# Altium project DA-12_MB.PrjPcb (part 2 of 4)
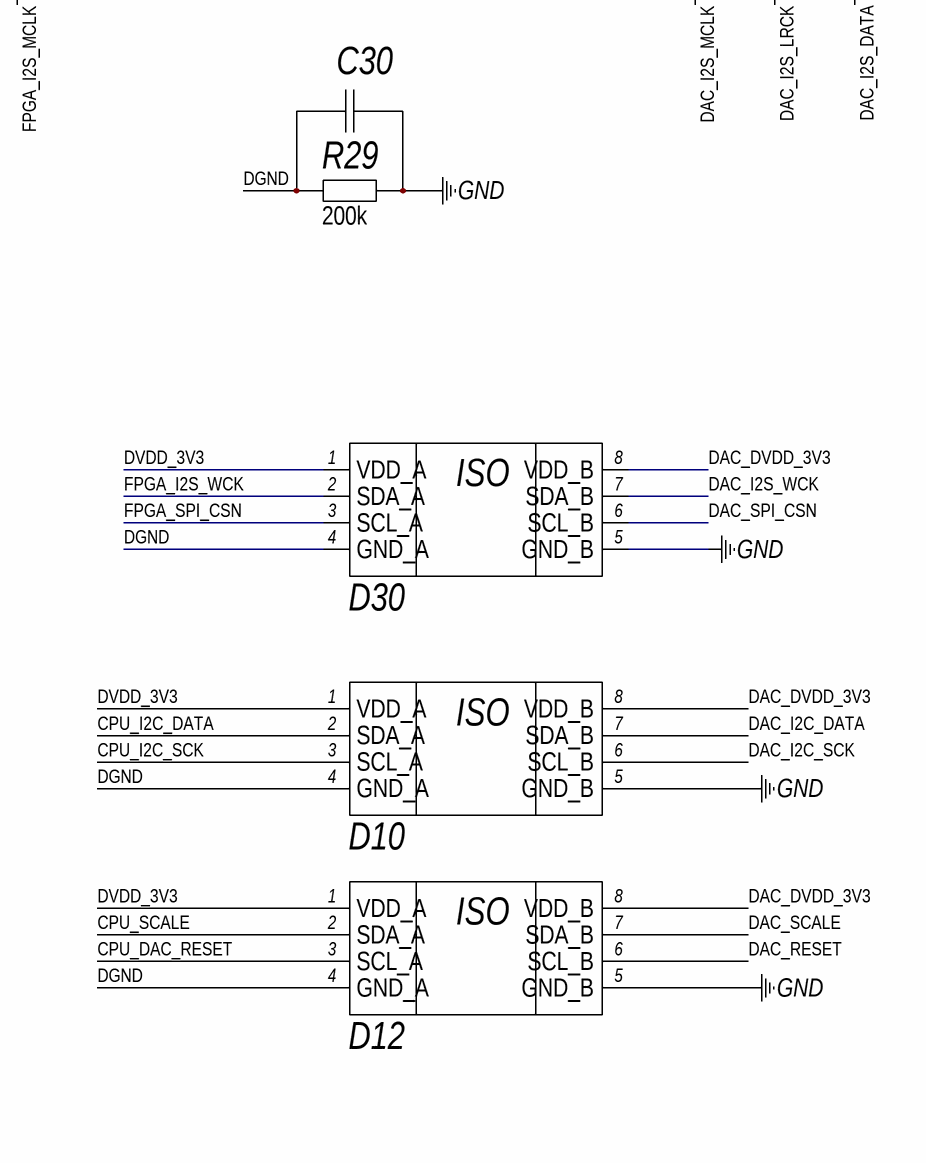
[diagram p14: da12-mb.SchDoc, bottom right]

## Sheet da12-mb.SchDoc (continued)

### Library data of the parts
C1 C3 C7 C8 C11 C15-C29 C32 C35 C37 C39 C42 C44 C191 C193 C195 C198 C199 C202-C235 = CC0805MRX7R9BB104: Ceramic capacitor 0805 X7R 0.1µF 50V; Manufacturer 1: Yageo; Tolerance: 20%; Capacitance: 100nF; Value: 0.1u; Type: Конденсатор; Supplier 1: Digi-Key; Supplier Part Number 1: 311-4351-1-ND; Manufacturer Part Number 1: CC0805MRX7R9BB104; RoHS: Yes; Category: Ceramic Capacitors; Stock 1: 29978; Pricing 1: 1=0,15000, 10=0,10700, 50=0,06080, 100=0,05040, 500=0,03536, 1000=0,02927 (USD); Mount: SMT; Case/Package: 0805; Min Operating Temperature: -55°C; Max Operating Temperature: 125°C; Packaging: Tape and Reel; Dielectric: X7R; Voltage Rating: 50V; Voltage Rating (DC): 50V; Series: CC; Length: 0.079inch; Width: 0.049inch; Thickness: 0.037inch; Depth: 1.25mm; Lead Free: Lead Free; Halogen Free: Halogen Free; RoHS Compliant: Yes; ComponentLink1URL: https://datasheet.ciiva.com/13207/upy-gphc-x7r-6-3v-to-50v-8-12304-13207535.pdf?src-supplier=Mouser; ComponentLink1Description: https://datasheet.ciiva.com/13207/upy-gphc-x7r-6-3v-to-50v-8-12304-13207535.pdf?src-supplier=Mouser; Case Code (Imperial): 0805; Case Code (Metric): 2012; Voltage: 50V
C4 = EEEFK1A102AP: Aluminium capacitor 10x10.2 1000 µF 10 V; Capacitance: 1mF; Tolerance: 20%; Ripple Current: 850mA; Voltage Rating: 10V; Impedance: 80mR; Life (Hours): 2000Hour; Leakage Current: 100uA; Dissipation Factor: 0.19%; Lead Length: 3.5mm; Value: 1mX10V; Type: Конденсатор электролитический; Supplier 1: Avnet; Supplier Part Number 1: EEE-FK1E471GP; Supplier 2: Arrow Electronics; Manufacturer 2: Panasonic; Manufacturer Part Number 2: EEE-FK1A102AP; RoHS: Yes; Category: Aluminum Electrolytic Capacitors; Stock 2: 4; Pricing 2: 1=0,75620, 500=0,34460 (USD); Mount: SMT; Case/Package: 10x10,2 (SMD-2); Number of Pins: 2; Contact Plating: Tin; Dielectric Material: Aluminium; Min Operating Temperature: -55°C; Max Operating Temperature: 105°C; Packaging: Tape and Reel; Voltage Rating (DC): 10V; Package Quantity: 500; Ripple Current (AC): 850mA; ESR (Equivalent Series Resistance): 80mR; Termination: SMD/SMT; Voltage: 10V; Series: FK; Construction: Cylindrical; Diameter: 10mm; Length: 10.2mm; Width: 10.3mm; Height: 10.2mm; Height - Seated (Max): 0.402inch; Lead Pitch: 4.6mm; Radiation Hardening: No; Lead Free: Lead Free; REACH SVHC: Unknown; RoHS Compliant: Yes; ComponentLink1URL: https://datasheet.ciiva.com/11783/0900766b80bed286-11783449.pdf?src-supplier=RSComponents; ComponentLink1Description: https://datasheet.ciiva.com/11783/0900766b80bed286-11783449.pdf?src-supplier=RSComponents; ComponentLink2URL: https://datasheet.ciiva.com/43454/58258-43454698.pdf?src-supplier=Farnell; ComponentLink2Description: https://datasheet.ciiva.com/43454/58258-43454698.pdf?src-supplier=Farnell; ComponentLink3URL: https://datasheet.ciiva.com/46388/58258-46388200.pdf?src-supplier=Element14; ComponentLink3Description: https://datasheet.ciiva.com/46388/58258-46388200.pdf?src-supplier=Element14; ComponentLink4URL: https://datasheet.ciiva.com/24024/aba0000ce120-24024165.pdf?src-supplier=Mouser; ComponentLink4Description: https://datasheet.ciiva.com/24024/aba0000ce120-24024165.pdf?src-supplier=Mouser; ComponentLink5URL: https://datasheet.ciiva.com/14602/70068081-14602683.pdf?src-supplier=Allied+Electronics; ComponentLink5Description: https://datasheet.ciiva.com/14602/70068081-14602683.pdf?src-supplier=Allied+Electronics; ComponentLink6URL: https://datasheet.ciiva.com/14607/70068081-14607445.pdf?src-supplier=Allied+Electronics; ComponentLink6Description: https://datasheet.ciiva.com/14607/70068081-14607445.pdf?src-supplier=Allied+Electronics; ComponentLink7URL: https://datasheet.ciiva.com/2985/aba0000ce119-2985368.pdf?src-supplier=Avnet; ComponentLink7Description: https://datasheet.ciiva.com/2985/aba0000ce119-2985368.pdf?src-supplier=Avnet; ComponentLink8URL: https://datasheet.ciiva.com/2985/aba0000ce119-2985367.pdf?src-supplier=Avnet; ComponentLink8Description: https://datasheet.ciiva.com/2985/aba0000ce119-2985367.pdf?src-supplier=Avnet; Case Code (Metric): 10x10.2
C5 C9 C31 C34 C36 C38 C41 C43 C189 C190 C194 C196 = TANT_B: Описание свойств компонента
C6 C10 C14 C197 = CC0805JRNPO9BN160: Ceramic capacitor 0805 C0G 16pF 50V; Manufacturer 1: Yageo; Manufacturer Part Number 1: CC0805JRNPO9BN220; Tolerance: 5%; Capacitance: 22pF; Value: 16p; Type: Конденсатор; Supplier 1: Digi-Key; Supplier Part Number 1: 311-1103-1-ND; RoHS: Yes; Category: Ceramic Capacitors; Stock 1: 117464; Pricing 1: 1=0,11000, 10=0,07800, 50=0,04280, 100=0,03490, 500=0,02492, 1000=0,01958 (USD); Mount: SMT; Case/Package: 0805; Number of Pins: 2; Case Code (Imperial): 0805; Case Code (Metric): 2012; Dielectric Material: Ceramic; Min Operating Temperature: -55°C; Max Operating Temperature: 125°C; Dielectric: C0G; Voltage Rating: 50V; Voltage Rating (DC): 50V; Packaging: Tape and Reel; Package Quantity: 1; Termination: SMD/SMT; Resistor Type: Ceramic; Voltage: 50V; Series: CC; Construction: Flat; Length: 2mm; Width: 1.25mm; Height: 0.6mm; Depth: 1.25mm; Thickness: 0.024inch; Radiation Hardening: No; REACH SVHC: No SVHC; Lead Free: Lead Free; RoHS Compliant: Yes; ComponentLink1URL: https://datasheet.ciiva.com/144/mlccorderingcode-144745.pdf?src-supplier=Digi-Key; ComponentLink1Description: https://datasheet.ciiva.com/144/mlccorderingcode-144745.pdf?src-supplier=Digi-Key; ComponentLink2URL: https://datasheet.ciiva.com/8033/1734582-8033931.pdf?src-supplier=Element14; ComponentLink2Description: https://datasheet.ciiva.com/8033/1734582-8033931.pdf?src-supplier=Element14; ComponentLink3URL: https://datasheet.ciiva.com/8033/1734582-8033933.pdf?src-supplier=Element14; ComponentLink3Description: https://datasheet.ciiva.com/8033/1734582-8033933.pdf?src-supplier=Element14; ComponentLink4URL: https://datasheet.ciiva.com/144/mlccorderingcode-144746.pdf?src-supplier=Digi-Key; ComponentLink4Description: https://datasheet.ciiva.com/144/mlccorderingcode-144746.pdf?src-supplier=Digi-Key; ComponentLink5URL: https://datasheet.ciiva.com/144/mlccorderingcode-144747.pdf?src-supplier=Digi-Key; ComponentLink5Description: https://datasheet.ciiva.com/144/mlccorderingcode-144747.pdf?src-supplier=Digi-Key; Supplier 2: Digi-Key; Manufacturer 2: Yageo; Manufacturer Part Number 2: CC0805JRNPO9BN160; Stock 2: 956; Pricing 2: 1=0,15000, 10=0,10700, 50=0,06080, 100=0,05040, 500=0,03536, 1000=0,02927 (USD); Weight: 0.000194oz; ComponentLink6URL: https://datasheet.ciiva.com/13264/upy-gp-np0-16v-to-50v-8-3714-13264491.pdf?src-supplier=Mouser; ComponentLink6Description: https://datasheet.ciiva.com/13264/upy-gp-np0-16v-to-50v-8-3714-13264491.pdf?src-supplier=Mouser; Supplier Part Number 2: 311-4228-1-ND
C12 C13 C200 C201 = CC0805JRNPO7BN220: Ceramic capacitor 0805 NPO 22pF 16V; Manufacturer 1: Yageo; Manufacturer Part Number 1: CC0805JRNPO9BN220; Tolerance: 5%; Dielectric: C0G; Voltage Rating: 50V; Value: 22p; Type: Конденсатор; Supplier 1: Digi-Key; Supplier Part Number 1: 311-1103-1-ND; RoHS: Yes; Category: Ceramic Capacitors; Stock 1: 117464; Pricing 1: 1=0,11000, 10=0,07800, 50=0,04280, 100=0,03490, 500=0,02492, 1000=0,01958 (USD); Mount: SMT; Case/Package: 0805; Number of Pins: 2; Case Code (Imperial): 0805; Case Code (Metric): 2012; Dielectric Material: Ceramic; Min Operating Temperature: -55°C; Max Operating Temperature: 125°C; Capacitance: 22pF; Voltage Rating (DC): 50V; Packaging: Tape and Reel; Package Quantity: 1; Termination: SMD/SMT; Resistor Type: Ceramic; Voltage: 50V; Series: CC; Construction: Flat; Length: 2mm; Width: 1.25mm; Height: 0.6mm; Depth: 1.25mm; Thickness: 0.024inch; Radiation Hardening: No; REACH SVHC: No SVHC; Lead Free: Lead Free; RoHS Compliant: Yes; ComponentLink1URL: https://datasheet.ciiva.com/144/mlccorderingcode-144745.pdf?src-supplier=Digi-Key; ComponentLink1Description: https://datasheet.ciiva.com/144/mlccorderingcode-144745.pdf?src-supplier=Digi-Key; ComponentLink2URL: https://datasheet.ciiva.com/8033/1734582-8033931.pdf?src-supplier=Element14; ComponentLink2Description: https://datasheet.ciiva.com/8033/1734582-8033931.pdf?src-supplier=Element14; ComponentLink3URL: https://datasheet.ciiva.com/8033/1734582-8033933.pdf?src-supplier=Element14; ComponentLink3Description: https://datasheet.ciiva.com/8033/1734582-8033933.pdf?src-supplier=Element14; ComponentLink4URL: https://datasheet.ciiva.com/144/mlccorderingcode-144746.pdf?src-supplier=Digi-Key; ComponentLink4Description: https://datasheet.ciiva.com/144/mlccorderingcode-144746.pdf?src-supplier=Digi-Key; ComponentLink5URL: https://datasheet.ciiva.com/144/mlccorderingcode-144747.pdf?src-supplier=Digi-Key; ComponentLink5Description: https://datasheet.ciiva.com/144/mlccorderingcode-144747.pdf?src-supplier=Digi-Key
C30 = GRM31CR71A226KE15L: Ceramic capacitor 1206 X7R 22µF 10V; Manufacturer 1: Murata; Capacitance: 22uF; Tolerance: 10%; Value: 22u; Type: Конденсатор; Supplier 1: Arrow Electronics; Supplier Part Number 1: GRM31CR71A226KE15L; Manufacturer Part Number 1: GRM31CR71A226KE15L; RoHS: Yes; Category: Ceramic Capacitors; Stock 1: 16303; Pricing 1: 1=0,81930, 10=0,51230, 25=0,48340, 100=0,42480, 250=0,42420, 500=0,35180, 1000=0,34810, 3000=0,30810, 6000=0,24770, 15000=0,23430 (USD); Mount: SMT; Case/Package: 1206; Case Code (Metric): 3216; Case Code (Imperial): 1206; Material: Ceramic; Min Operating Temperature: -55°C; Max Operating Temperature: 125°C; Dielectric: X7R; Packaging: Tape and Reel; Package Quantity: 1; Voltage Rating: 10V; Voltage Rating (DC): 10V; Termination: SMD/SMT; Voltage: 10V; Series: GRM; Construction: Flat; Length: 3.2mm; Width: 0.063inch; Height: 1.6mm; Thickness: 0.071inch; Depth: 1.6mm; Radiation Hardening: No; REACH SVHC: No SVHC; Lead Free: Lead Free; RoHS Compliant: Yes; ComponentLink1URL: https://datasheet.ciiva.com/6072/1747483-6072695.pdf?src-supplier=Farnell; ComponentLink1Description: https://datasheet.ciiva.com/6072/1747483-6072695.pdf?src-supplier=Farnell; ComponentLink2URL: https://datasheet.ciiva.com/11787/0900766b80ef921d-11787760.pdf?src-supplier=RSComponents; ComponentLink2Description: https://datasheet.ciiva.com/11787/0900766b80ef921d-11787760.pdf?src-supplier=RSComponents; ComponentLink3URL: https://datasheet.ciiva.com/3777/1492grm31cr71a226ke1523-3777120.pdf?src-supplier=Arrow+Electronics; ComponentLink3Description: https://datasheet.ciiva.com/3777/1492grm31cr71a226ke1523-3777120.pdf?src-supplier=Arrow+Electronics; ComponentLink4URL: https://datasheet.ciiva.com/29202/451120-da-01-de-vs-chip-kond-1206-22-0-uf-10pr-10-0v-x7r-29202604.pdf?src-supplier=Conrad; ComponentLink4Description: https://datasheet.ciiva.com/29202/451120-da-01-de-vs-chip-kond-1206-22-0-uf-10pr-10-0v-x7r-29202604.pdf?src-supplier=Conrad; ComponentLink5URL: https://datasheet.ciiva.com/29202/451412-da-01-de-vs-kondens-grm31-cr71a-226ke15l-29202268.pdf?src-supplier=Conrad; ComponentLink5Description: https://datasheet.ciiva.com/29202/451412-da-01-de-vs-kondens-grm31-cr71a-226ke15l-29202268.pdf?src-supplier=Conrad; ComponentLink6URL: https://datasheet.ciiva.com/14116/grmseries-highdielectrictype-eng-14116398.pdf?src-supplier=Distrelec; ComponentLink6Description: https://datasheet.ciiva.com/14116/grmseries-highdielectrictype-eng-14116398.pdf?src-supplier=Distrelec; ComponentLink7URL: https://datasheet.ciiva.com/7937/1747483-7937735.pdf?src-supplier=Element14; ComponentLink7Description: https://datasheet.ciiva.com/7937/1747483-7937735.pdf?src-supplier=Element14; ComponentLink8URL: https://datasheet.ciiva.com/142/partnumbering-e-01-142120.pdf?src-supplier=Digi-Key; ComponentLink8Description: https://datasheet.ciiva.com/142/partnumbering-e-01-142120.pdf?src-supplier=Digi-Key; ComponentLink9URL: https://datasheet.ciiva.com/142/partnumbering-e-01-142119.pdf?src-supplier=Digi-Key; ComponentLink9Description: https://datasheet.ciiva.com/142/partnumbering-e-01-142119.pdf?src-supplier=Digi-Key; ComponentLink10URL: https://datasheet.ciiva.com/142/partnumbering-e-01-142121.pdf?src-supplier=Digi-Key; ComponentLink10Description: https://datasheet.ciiva.com/142/partnumbering-e-01-142121.pdf?src-supplier=Digi-Key; ComponentLink11URL: https://datasheet.ciiva.com/48671/product-48671339.pdf?src-supplier=Avnet; ComponentLink11Description: https://datasheet.ciiva.com/48671/product-48671339.pdf?src-supplier=Avnet; ComponentLink12URL: https://datasheet.ciiva.com/16440/product-16440671.pdf?src-supplier=Future+Electronics; ComponentLink12Description: https://datasheet.ciiva.com/16440/product-16440671.pdf?src-supplier=Future+Electronics; ComponentLink13URL: https://datasheet.ciiva.com/2989/product-2989773.pdf?src-supplier=Avnet; ComponentLink13Description: https://datasheet.ciiva.com/2989/product-2989773.pdf?src-supplier=Avnet
C33 C40 C192 = CC0805MRX7R9BB101: Ceramic capacitor 0805 X7R 100pF 50V; Capacitance: 1nF; Tolerance: 20%; Value: 100p; Type: Конденсатор; Supplier 1: Digi-Key; Supplier Part Number 1: 311-4349-1-ND; Supplier 2: Mouser; Manufacturer 2: Yageo; Manufacturer Part Number 2: CC0805MRX7R9BB102; RoHS: Yes; Category: Ceramic Capacitors; Stock 2: 5617; Pricing 2: 1=0,14000, 10=0,08800, 50=0,08800, 100=0,03900, 1000=0,02500, 10000=0,02100 (USD); Mount: SMT; Case/Package: 0805; Min Operating Temperature: -55°C; Max Operating Temperature: 125°C; Packaging: Tape and Reel; Voltage Rating (DC): 50V; Dielectric: X7R; Resistor Type: Ceramic; Voltage Rating: 50V; Series: CC; Length: 0.079inch; Width: 0.049inch; Thickness: 0.028inch; Depth: 1.25mm; Lead Free: Lead Free; Halogen Free: Halogen Free; RoHS Compliant: Yes; ComponentLink1URL: http://www.mouser.com/ds/2/447/Yageo_UPY-GP_NP0_16V-to-50V_9-358835.pdf?src-supplier=Mouser; ComponentLink1Description: http://www.mouser.com/ds/2/447/Yageo_UPY-GP_NP0_16V-to-50V_9-358835.pdf?src-supplier=Mouser; ComponentLink2URL: http://components.arrow.com/part/dataview/0323_04166629?src-supplier=Arrow+Europe; ComponentLink2Description: http://components.arrow.com/part/dataview/0323_04166629?src-supplier=Arrow+Europe; ComponentLink3URL: http://www.yageo.com/documents/recent/UPY-GPHC_X7R_6.3V-to-50V_18.pdf?src-supplier=Digi-Key; ComponentLink3Description: http://www.yageo.com/documents/recent/UPY-GPHC_X7R_6.3V-to-50V_18.pdf?src-supplier=Digi-Key; Supplier Part Number 2: 603-CC805MRX7R9BB102; Case Code (Imperial): 0805; Case Code (Metric): 2012; Voltage: 50V
D1 = USBLC6-4SC6: Very low capacitance ESD protection; Type: Микросхема; Case/Package: SOT-23-6; Mount: SMT; Supplier 1: Future Electronics; Supplier Part Number 1: 7131158; Value: USBLC6-4SC6
D2 = SN74LVC1G14DBVR: Single Schmitt-Trigger Inverter; Type: Микросхема; Supplier 1: Digi-Key; Supplier Part Number 1: 296-11607-1-ND; Case/Package: SOT-23-5; Mount: SMT; Value: SN74LVC1G14
D3 D5 D32 = OSC_4PIN_DIL: Описание свойств компонента
D4 = CT7601: Описание свойств компонента
D6 = 1G32: Описание свойств компонента
D7 D33 = W25Q32JVSS: 3V 32M-BIT SERIAL FLASH MEMORY WITH DUAL, QUAD SPI; Type: Микросхема; Value: W25Q32; Supplier 1: Digi-Key; Supplier Part Number 1: W25Q32JVSSIQCT-ND; Case/Package: SOIC-8-208; Mount: SMT; Supplier 2: Digi-Key; Supplier 3: RSComponents; Supplier 4: Arrow Electronics; Supplier 5: RSComponents; Supplier Part Number 2: W25Q32JVSSIQ-ND; Supplier Part Number 3: 1882528; Supplier Part Number 4: W25Q32JVSSIM TR; Supplier Part Number 5: 1712228
D8 = ADUM140X: Описание свойств компонента
D9 D11 D31 = SY8088: Описание свойств компонента
D10 D12 D30 = ADUM1250: Описание свойств компонента
J = USB-B-S-X-X-TH-TR: USB-B Series USB 2.0 Interface, Type B; MP: USB-B-S-S-B-TH-TR; MF: Samtec; Price: None; Availability: Unavailable; Package: None; SnapEDA_Link: https://www.snapeda.com/parts/USB-B-S-S-B-TH-TR/Samtec/view-part/230657/?ref=snap; Value: *
L1-L6 L9 L12 L24 L25 = SMD_BLM0805: Описание свойств компонента
L7 L8 L10 L11 L22 L23 = LQH32MN220J23L: Chip Coils for DC-DC Converter Wire Wound Type / LQH32MN_23 Series 1210 (3225) 220 uH, 150 mA; Type: Катушка индуктивности; Value: 1210; Supplier 1: Digi-Key; Supplier Part Number 1: 490-4048-1-ND; Case/Package: SMD-2; Mount: SMT
P1 P2 = Header 5X2: Header, 5-Pin, Dual row; LatestRevisionDate: 17-Jul-2002; LatestRevisionNote: Re-released for DXP Platform.; Publisher: Altium Limited
P3 = Header 3: Header, 3-Pin; LatestRevisionDate: 17-Jul-2002; LatestRevisionNote: Re-released for DXP Platform.; Publisher: Altium Limited
R2-R5 R28 R30-R32 = RC0805JR-0710KL: Chip Resistor Surface Mount 0805 10 кОм; Manufacturer 1: Yageo; Tolerance: 5%; Resistance: 10kR; Power Rating: 125mW; Temperature Coefficient: 100ppm/°C; Voltage Rating: 150V; Value: 10k; Supplier 1: RSComponents; Supplier Part Number 1: 1995759; Manufacturer Part Number 1: RC0805JR-0710KL; RoHS: Yes; Category: Chip SMD Resistors; Stock 1: 30000; Pricing 1: 5000=0,00300 (GBP); Case/Package: 0805; Contact Plating: Tin,Matte; Case Code (Imperial): 0805; Case Code (Metric): 2012; Size Code: 0805; Min Operating Temperature: -55°C; Max Operating Temperature: 155°C; Resistor Type: Thick Film; Packaging: Tape and Reel; Termination: SMD/SMT; Features: Moisture Resistant; Series: RC; Max Power Dissipation: 125mW; Number of Terminations: 2; Resistance Tolerance: 5%; Construction: Rectangular; Length: 2mm; Width: 1.25mm; Height: 0.5mm; Depth: 1.25mm; Radiation Hardening: No; RoHS Compliant: Yes; REACH SVHC: Unknown; Military Standard: Not; Lead Free: Lead Free; ComponentLink1URL: https://datasheet.ciiva.com/7983/444164-7983765.pdf?src-supplier=Element14; ComponentLink1Description: https://datasheet.ciiva.com/7983/444164-7983765.pdf?src-supplier=Element14; ComponentLink2URL: https://datasheet.ciiva.com/7941/444164-7941870.pdf?src-supplier=Element14; ComponentLink2Description: https://datasheet.ciiva.com/7941/444164-7941870.pdf?src-supplier=Element14; ComponentLink3URL: https://datasheet.ciiva.com/7941/444164-7941871.pdf?src-supplier=Element14; ComponentLink3Description: https://datasheet.ciiva.com/7941/444164-7941871.pdf?src-supplier=Element14; Mount: SMT; Type: Резистор
R7 R8 = RC0805JR-0724RL: Chip Resistor Surface Mount 0805 24 Ом; Manufacturer 1: Yageo; Resistance: 24R; Tolerance: 5%; Temperature Coefficient: 100ppm/°C; Power Rating: 125mW; Voltage Rating: 150V; Value: 24; Supplier 1: Arrow Electronics; Supplier Part Number 1: RC0805JR-0724RL; Manufacturer Part Number 1: RC0805JR-0724RL; RoHS: Yes; Category: Chip SMD Resistors; Stock 1: 375; Pricing 1: 1=0,06100, 10=0,03050, 25=0,03020, 100=0,01240, 250=0,01230 (USD); Case/Package: 0805; Contact Plating: Tin,Matte,Lead; Case Code (Metric): 2012; Case Code (Imperial): 0805; Size Code: 0805; Min Operating Temperature: -55°C; Max Operating Temperature: 155°C; Resistor Type: Thick Film; Package Quantity: 1; Packaging: Tape and Reel; Number of Terminations: 2; Termination: SMD/SMT; Max Power Dissipation: 125mW; Voltage Rating (DC): 150V; Features: Moisture Resistant; Series: RC; Construction: Rectangular; Length: 2mm; Width: 0.049inch; Height: 0.024inch; Depth: 1.25mm; Radiation Hardening: No; Military Standard: Not; Lead Free: Lead Free; RoHS Compliant: Yes; ComponentLink1URL: https://datasheet.ciiva.com/2456/pyu-r-int-thick-7-2456171.pdf?src-supplier=Digi-Key; ComponentLink1Description: https://datasheet.ciiva.com/2456/pyu-r-int-thick-7-2456171.pdf?src-supplier=Digi-Key; ComponentLink2URL: https://datasheet.ciiva.com/2456/pyu-r-int-thick-7-2456172.pdf?src-supplier=Digi-Key; ComponentLink2Description: https://datasheet.ciiva.com/2456/pyu-r-int-thick-7-2456172.pdf?src-supplier=Digi-Key; ComponentLink3URL: https://datasheet.ciiva.com/2456/pyu-r-int-thick-7-2456170.pdf?src-supplier=Digi-Key; ComponentLink3Description: https://datasheet.ciiva.com/2456/pyu-r-int-thick-7-2456170.pdf?src-supplier=Digi-Key; ComponentLink4URL: https://datasheet.ciiva.com/16776/rc0805-16776854.pdf?src-supplier=Future+Electronics; ComponentLink4Description: https://datasheet.ciiva.com/16776/rc0805-16776854.pdf?src-supplier=Future+Electronics; Mount: SMT; Type: Резистор
R9 R12-R17 R22-R27 R86-R88 R90 R100 R125-R130 R137-R140 R147 = RC0805JR-0710RL: Chip Resistor Surface Mount 0805 10 Ом; Manufacturer 1: Yageo; Tolerance: 5%; Resistance: 10R; Temperature Coefficient: 200ppm/°C; Voltage Rating: 150V; Power Rating: 125mW; Value: 10; Supplier 1: Arrow Electronics; Supplier Part Number 1: RC0805JR-0710RL; Manufacturer Part Number 1: RC0805JR-0710RL; RoHS: Yes; Category: Chip SMD Resistors; Stock 1: 27; Pricing 1: 1=0,07580, 10=0,05800, 25=0,05130 (USD); Case/Package: 0805; Contact Plating: Tin,Matte,Lead; Case Code (Imperial): 0805; Case Code (Metric): 2012; Size Code: 0805; Min Operating Temperature: -55°C; Max Operating Temperature: 155°C; Packaging: Tape and Reel; Resistor Type: Thick Film; Package Quantity: 1; Termination: SMD/SMT; Number of Terminations: 2; Max Power Dissipation: 125mW; Features: Moisture Resistant; Series: RC; Resistance Tolerance: 5%; Length: 0.079inch; Width: 0.049inch; Height: 0.024inch; Radiation Hardening: No; REACH SVHC: Unknown; Lead Free: Lead Free; RoHS Compliant: Yes; ComponentLink1URL: https://datasheet.ciiva.com/46395/444164-46395129.pdf?src-supplier=Element14; ComponentLink1Description: https://datasheet.ciiva.com/46395/444164-46395129.pdf?src-supplier=Element14; ComponentLink2URL: https://datasheet.ciiva.com/2456/pyu-r-int-thick-7-2456041.pdf?src-supplier=Digi-Key; ComponentLink2Description: https://datasheet.ciiva.com/2456/pyu-r-int-thick-7-2456041.pdf?src-supplier=Digi-Key; ComponentLink3URL: https://datasheet.ciiva.com/2456/pyu-r-int-thick-7-2456042.pdf?src-supplier=Digi-Key; ComponentLink3Description: https://datasheet.ciiva.com/2456/pyu-r-int-thick-7-2456042.pdf?src-supplier=Digi-Key; ComponentLink4URL: https://datasheet.ciiva.com/2456/pyu-r-int-thick-7-2456040.pdf?src-supplier=Digi-Key; ComponentLink4Description: https://datasheet.ciiva.com/2456/pyu-r-int-thick-7-2456040.pdf?src-supplier=Digi-Key; ComponentLink5URL: https://datasheet.ciiva.com/12667/rc0805-12667031.pdf?src-supplier=Mouser; ComponentLink5Description: https://datasheet.ciiva.com/12667/rc0805-12667031.pdf?src-supplier=Mouser; Mount: SMT; Type: Резистор
R10 = RC0805JR-0718RL: Chip Resistor Surface Mount 0805 18 Ом; Manufacturer 1: Yageo; Tolerance: 5%; Resistance: 18R; Temperature Coefficient: 100ppm/°C; Power Rating: 125mW; Voltage Rating: 150V; Value: 18; Supplier 1: Arrow Electronics; Supplier Part Number 1: RC0805JR-0718RL; Manufacturer Part Number 1: RC0805JR-0718RL; RoHS: Yes; Category: Chip SMD Resistors; Stock 1: 12330; Pricing 1: 1=0,03540, 10=0,01050, 25=0,01040, 100=0,00430, 250=0,00420, 1000=0,00230, 3000=0,00210, 6000=0,00180 (USD); Case/Package: 0805; Contact Plating: Tin,Matte,Lead; Case Code (Metric): 2012; Case Code (Imperial): 0805; Size Code: 0805; Min Operating Temperature: -55°C; Max Operating Temperature: 155°C; Resistor Type: Thick Film; Package Quantity: 1; Packaging: Tape and Reel; Number of Terminations: 2; Termination: SMD/SMT; Max Power Dissipation: 125mW; Features: Moisture Resistant; Series: RC; Construction: Rectangular; Resistance Tolerance: 5%; Length: 2mm; Width: 0.049inch; Height: 0.024inch; Depth: 1.25mm; Radiation Hardening: No; REACH SVHC: Unknown; Military Standard: Not; Lead Free: Lead Free; RoHS Compliant: Yes; ComponentLink1URL: https://datasheet.ciiva.com/2508/pyu-r-int-thick-7-2508730.pdf?src-supplier=Digi-Key; ComponentLink1Description: https://datasheet.ciiva.com/2508/pyu-r-int-thick-7-2508730.pdf?src-supplier=Digi-Key; ComponentLink2URL: https://datasheet.ciiva.com/2508/pyu-r-int-thick-7-2508731.pdf?src-supplier=Digi-Key; ComponentLink2Description: https://datasheet.ciiva.com/2508/pyu-r-int-thick-7-2508731.pdf?src-supplier=Digi-Key; ComponentLink3URL: https://datasheet.ciiva.com/2508/pyu-r-int-thick-7-2508729.pdf?src-supplier=Digi-Key; ComponentLink3Description: https://datasheet.ciiva.com/2508/pyu-r-int-thick-7-2508729.pdf?src-supplier=Digi-Key; ComponentLink4URL: https://datasheet.ciiva.com/12558/rc0805-257173-12558905.pdf?src-supplier=Mouser; ComponentLink4Description: https://datasheet.ciiva.com/12558/rc0805-257173-12558905.pdf?src-supplier=Mouser; ComponentLink5URL: https://datasheet.ciiva.com/7941/442941-7941903.pdf?src-supplier=Element14; ComponentLink5Description: https://datasheet.ciiva.com/7941/442941-7941903.pdf?src-supplier=Element14; ComponentLink6URL: https://datasheet.ciiva.com/17043/rc0805-17043703.pdf?src-supplier=Future+Electronics; ComponentLink6Description: https://datasheet.ciiva.com/17043/rc0805-17043703.pdf?src-supplier=Future+Electronics; Mount: SMT; Type: Резистор
R18 R19 R131-R136 R141-R146 = RC0805JR-07100KL: Chip Resistor Surface Mount 0805 100 кОм; Manufacturer 1: Yageo; Resistance: 100kR; Tolerance: 5%; Temperature Coefficient: 100ppm/°C; Power Rating: 125mW; Voltage Rating: 150V; Value: 100k; Supplier 1: Arrow Electronics; Supplier Part Number 1: RC0805JR-07100KL; Manufacturer Part Number 1: RC0805JR-07100KL; RoHS: Yes; Category: Chip SMD Resistors; Stock 1: 22; Pricing 1: 1=0,05570, 10=0,03050 (USD); Case/Package: 0805; Contact Plating: Tin,Matte,Lead; Case Code (Imperial): 0805; Case Code (Metric): 2012; Size Code: 0805; Min Operating Temperature: -55°C; Max Operating Temperature: 155°C; Resistor Type: Thick Film; Packaging: Tape and Reel; Termination: SMD/SMT; Features: Moisture Resistant; Series: RC; Max Power Dissipation: 125mW; Number of Terminations: 2; Construction: Rectangular; Resistance Tolerance: 5%; Length: 2mm; Depth: 1.25mm; Radiation Hardening: No; REACH SVHC: Unknown; Lead Free: Lead Free; Military Standard: Not; RoHS Compliant: Yes; ComponentLink1URL: https://datasheet.ciiva.com/7941/442941-7941865.pdf?src-supplier=Element14; ComponentLink1Description: https://datasheet.ciiva.com/7941/442941-7941865.pdf?src-supplier=Element14; ComponentLink2URL: https://datasheet.ciiva.com/7941/442941-7941864.pdf?src-supplier=Element14; ComponentLink2Description: https://datasheet.ciiva.com/7941/442941-7941864.pdf?src-supplier=Element14; ComponentLink3URL: https://datasheet.ciiva.com/15190/getdatasheetpartid-479267-15190029.pdf?src-supplier=Verical; ComponentLink3Description: https://datasheet.ciiva.com/15190/getdatasheetpartid-479267-15190029.pdf?src-supplier=Verical; Mount: SMT; Type: Резистор
R29 = RC1206JR-07200KL: Chip Resistor Surface Mount 1206 200 кОм; Manufacturer 1: Yageo; Resistance: 200kR; Power Rating: 250mW; Tolerance: 5%; Temperature Coefficient: 100ppm/°C; Voltage Rating (DC): 400V; Supplier 1: Arrow Electronics; Supplier Part Number 1: RC1206JR-07200KL; Manufacturer Part Number 1: RC1206JR-07200KL; RoHS 1: Yes; Category: Chip SMD Resistors; Stock 1: 45000; Pricing 1: 5000=0,00440 (USD); Case/Package: 1206; Case Code (Metric): 3216; Case Code (Imperial): 1206; Size Code: 1206; Min Operating Temperature: -55°C; Max Operating Temperature: 155°C; Package Quantity: 1; Packaging: Tape and Reel; Resistor Type: Thick Film; Number of Terminations: 2; Max Power Dissipation: 250mW; Features: Moisture Resistant; Series: RC; Construction: Rectangular; Length: 0.122inch; Width: 0.063inch; Height: 0.026inch; Depth: 1.6mm; Military Standard: Not; Lead Free: Lead Free; RoHS Compliant: Yes; ComponentLink1URL: https://datasheet.ciiva.com/2520/pyu-r-int-thick-7-2520645.pdf?src-supplier=Digi-Key; ComponentLink1Description: https://datasheet.ciiva.com/2520/pyu-r-int-thick-7-2520645.pdf?src-supplier=Digi-Key; ComponentLink2URL: https://datasheet.ciiva.com/2520/pyu-r-int-thick-7-2520646.pdf?src-supplier=Digi-Key; ComponentLink2Description: https://datasheet.ciiva.com/2520/pyu-r-int-thick-7-2520646.pdf?src-supplier=Digi-Key; ComponentLink3URL: https://datasheet.ciiva.com/16746/pyu-rc1206-51-rohs-l-4-16746043.pdf?src-supplier=Future+Electronics; ComponentLink3Description: https://datasheet.ciiva.com/16746/pyu-rc1206-51-rohs-l-4-16746043.pdf?src-supplier=Future+Electronics; Mount: SMT; Type: Резистор
U1 = EP4CE22E22C6: Cyclone IV Family FPGA, 2V Core, 79 I/O Pins, 4 PLLs, 144-Pin QFP, Speed Grade 6, Commercial Grade; Published: 3-May-2010; DatasheetVersion: ver1.2, Mar-2010; PackageVersion: ver16.0, Dec-2009; PackageReference: EQFP144; Publisher: Altium Limited; PackageDescription: 144-Pin Plastic Enhanced Quad Flat Pack (EQFP144) - Wire Bond; Supplier 1: Digi-Key; Supplier Part Number 1: EP4CE22E22C6-ND; Code_JEDEC: MS-026-BFB; ComponentLink1Description: Manufacturer Link; ComponentLink1URL: http://www.altera.com/; ComponentLink2Description: Handbook; ComponentLink2URL: http://www.altera.com/literature/hb/cyclone-iv/cyclone4-handbook.pdf; ComponentLink3Description: Pinout Specification; ComponentLink3URL: http://www.altera.com/literature/lit-dp.jsp?category=cyc%204&showspreadsheet=y; ComponentLink4Description: Packaging Specification; ComponentLink4URL: http://www.altera.com/literature/ds/dspkg.pdf
U2 = STM32F103CBT6: STM32 ARM-based 32-bit MCU with 128 Kbytes Flash, 48-pin LQFP, Industrial Temperature; Published: 30-May-2008; DatasheetVersion: rev6, Mar-2008; PackageVersion: Mar-2008; PackageReference: LQFP48; Publisher: Altium Limited; PackageDescription: 48-Pin Low-Profile Quad Flat Pack, 7 x 7 mm Body, 0.5 mm Pitch (LQFP48); ComponentLink1Description: Manufacturer Link; ComponentLink1URL: www.st.com/stm32; ComponentLink2Description: Datasheet; ComponentLink2URL: http://www.st.com/stonline/products/literature/ds/13587.pdf
U3 = W25Qxx
X1-X6 X15 = C_P: Контрольная площадка; Value: 0; Marck-1: *; Case/Package: SMD-1; Mount: SMT; Type: Точка контрольная
X7 X17 = HC-49: Описание свойств компонента